# EAGLE design PWM Driver (EAGLE 9.6.2)
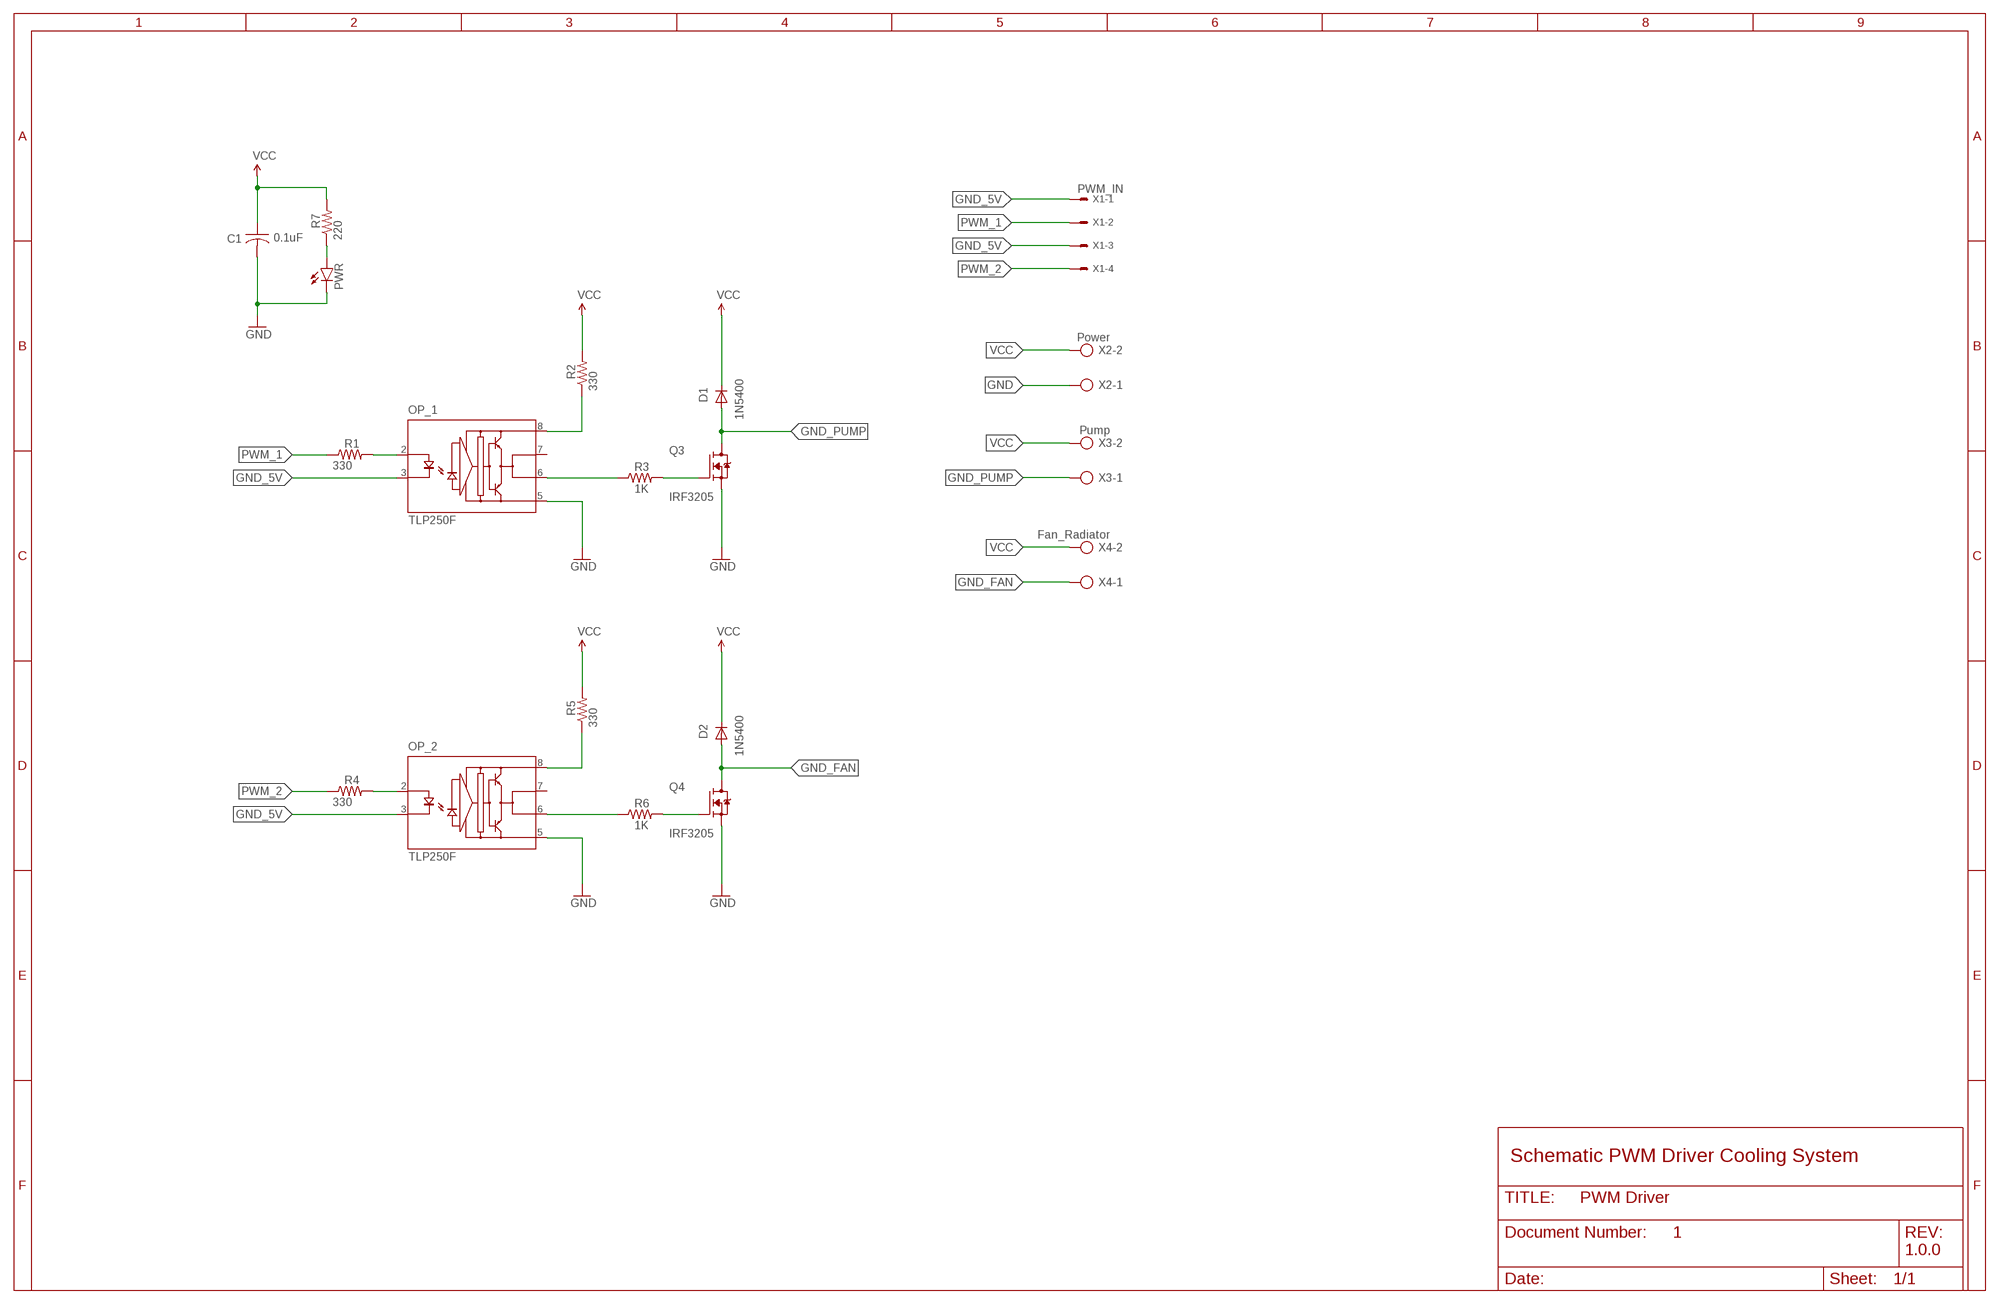
[diagram p0: schematic, sheet 1]
FRAME1 (FRAME_B_L): DESIGNER: PRATIK MAKWANA; DOC: 1; REV: 1.0.0

## Parts
C1  0.1uF  C-US050-030X075  [C050-030X075]
D1  1N5400  [DO201-15]
D2  1N5400  [DO201-15]
OP_1  TLP250F  [DIL08]
OP_2  TLP250F  [DIL08]
PWR  LED5MM  [LED5MM]
Q3  IRF3205  [TO254P1041X444X2933-3]
Q4  IRF3205  [TO254P1041X444X2933-3]
R1  330  R-US_0207/10  [0207/10]
R2  330  R-US_0411/15  [0411/15]
R3  1K  R-US_0411/15  [0411/15]
R4  330  R-US_0207/10  [0207/10]
R5  330  R-US_0411/15  [0411/15]
R6  1K  R-US_0411/15  [0411/15]
R7  220  R-US_0207/10  [0207/10]
X1  PWM_IN  22-23-2041  [22-23-2041]
X2  Power  AK500/2  [AK500/2]
X3  Pump  AK500/2  [AK500/2]
X4  Fan_Radiator  AK500/2  [AK500/2]

## Nets
GND: C1.2 OP_1.5(GND) OP_2.5(GND) PWR.K(C) Q3.3(S) Q4.3(S) X2.1
GND_5V: OP_1.3(K) OP_2.3(K) X1.1 X1.3
GND_FAN: D2.A Q4.2(D) X4.1
GND_PUMP: D1.A Q3.2(D) X3.1
N$1: OP_2.2(A) R4.2
N$2: OP_1.2(A) R1.2
N$3: OP_2.6(VO) R6.1
N$4: OP_1.6(VO) R3.1
N$5: Q3.1(G) R3.2
N$6: PWR.A R7.1
N$7: OP_1.8(VCC) R2.1
N$8: Q4.1(G) R6.2
N$9: OP_2.8(VCC) R5.1
PWM_1: R1.1 X1.2
PWM_2: R4.1 X1.4
VCC: C1.1 D1.C D2.C R2.2 R5.2 R7.2 X2.2 X3.2 X4.2
Unconnected: OP_1.7(VO') OP_2.7(VO')

## Notes on the sheet
- Schematic PWM Driver Cooling System

## Library data of the parts
C1 = adafruit:C-US: CAPACITOR, American symbol
D1 D2 = diode:1N5400: DIODE standard rectifier, 3 A, 50 V (Motorola)
OP_1 OP_2 = optocoupler-3-jcn:TLP250F: Toshiba Transistor Inverter Inverter For Air Conditionor IGBT Gate Drive Power MOS FET Gate Drive
PWR = led:LED: LED OSRAM: - CHIPLED LG R971, LG N971, LY N971, LG Q971, LY Q971, LO R971, LY R971 LH N974, LH R974 LS Q976, LO Q976, LY Q976 LO Q996 - Hyper CHIPLED LW Q18S LB Q993, LB Q99A, LB R99A - SideLED LS A670, LO A670, LY A670, LG A670, LP A670 LB A673, LV A673, LT A673, LW A673 LH A674 LY A675 LS A676, LA A676, LO A676, LY A676, LW A676 LS A679, LY A679, LG A679 - Hyper Micro SIDELED® LS Y876, LA Y876, LO Y876, LY Y876 LT Y87S - SmartLED LW L88C, LW L88S LB L89C, LB L89S, LG L890 LS L89K, LO L89K, LY L89K LS L896, LA L896, LO L896, LY L896 - TOPLED LS T670, LO T670, LY T670, LG T670, LP T670 LSG T670, LSP T670, LSY T670, LOP T670, LYG T670 LG T671, LOG T671, LSG T671 LB T673, LV T673, LT T673, LW T673 LH T674 LS T676, LA T676, LO T676, LY T676, LB T676, LH T676, LSB T676, LW T676 LB T67C, LV T67C, LT T67C, LS T67K, LO T67K, LY T67K, LW E67C LS E67B, LA E67B, LO E67B, LY E67B, LB E67C, LV E67C, LT E67C LW T67C LS T679, LY T679, LG T679 LS T770, LO T770, LY T770, LG T770, LP T770 LB T773, LV T773, LT T773, LW T773 LH T774 LS E675, LA E675, LY E675, LS T675 LS T776, LA T776, LO T776, LY T776, LB T776 LHGB T686 LT T68C, LB T68C - Hyper Mini TOPLED® LB M676 - Mini TOPLED Santana® LG M470 LS M47K, LO M47K, LY M47K Source: http://www.osram.convergy.de LUXEON: - LUMILED® LXK2-PW12-R00, LXK2-PW12-S00, LXK2-PW14-U00, LXK2-PW14-V00 LXK2-PM12-R00, LXK2-PM12-S00, LXK2-PM14-U00 LXK2-PE12-Q00, LXK2-PE12-R00, LXK2-PE12-S00, LXK2-PE14-T00, LXK2-PE14-U00 LXK2-PB12-K00, LXK2-PB12-L00, LXK2-PB12-M00, LXK2-PB14-N00, LXK2-PB14-P00, LXK2-PB14-Q00 LXK2-PR12-L00, LXK2-PR12-M00, LXK2-PR14-Q00, LXK2-PR14-R00 LXK2-PD12-Q00, LXK2-PD12-R00, LXK2-PD12-S00 LXK2-PH12-R00, LXK2-PH12-S00 LXK2-PL12-P00, LXK2-PL12-Q00, LXK2-PL12-R00 Source: www.luxeon.com KINGBRIGHT: KA-3528ASYC Source: www.kingbright.com
Q3 Q4 = IRF3205:IRF3205: N-Channel 55V 75A (Tc) 170W (Tc) Through Hole TO-220AB Check availability <https://pricing.snapeda.com/parts/IRF3205/Infineon%20Technologies/view-part?ref=eda>; AVAILABILITY: In Stock; CHECK_PRICES: https://www.snapeda.com/parts/IRF3205/Infineon/view-part/?ref=eda; DESCRIPTION: N-Channel 55V 110A (Tc) 200W (Tc) Through Hole TO-220AB; MF: Infineon Technologies; MP: IRF3205; PACKAGE: TO-220 Infineon; PRICE: None; SNAPEDA_LINK: https://www.snapeda.com/parts/IRF3205/Infineon/view-part/?ref=snap
R1-R7 = adafruit:R-US_: RESISTOR, American symbol
X1 = con-molex:22-23-2041: .100" (2.54mm) Center Header - 4 Pin; MF: MOLEX; MPN: 22-23-2041; OC_FARNELL: 1462920; OC_NEWARK: 38C0355
X2-X4 = con-ptr500:AK500/2: CONNECTOR; OC_FARNELL: unknown; OC_NEWARK: unknown

## Board
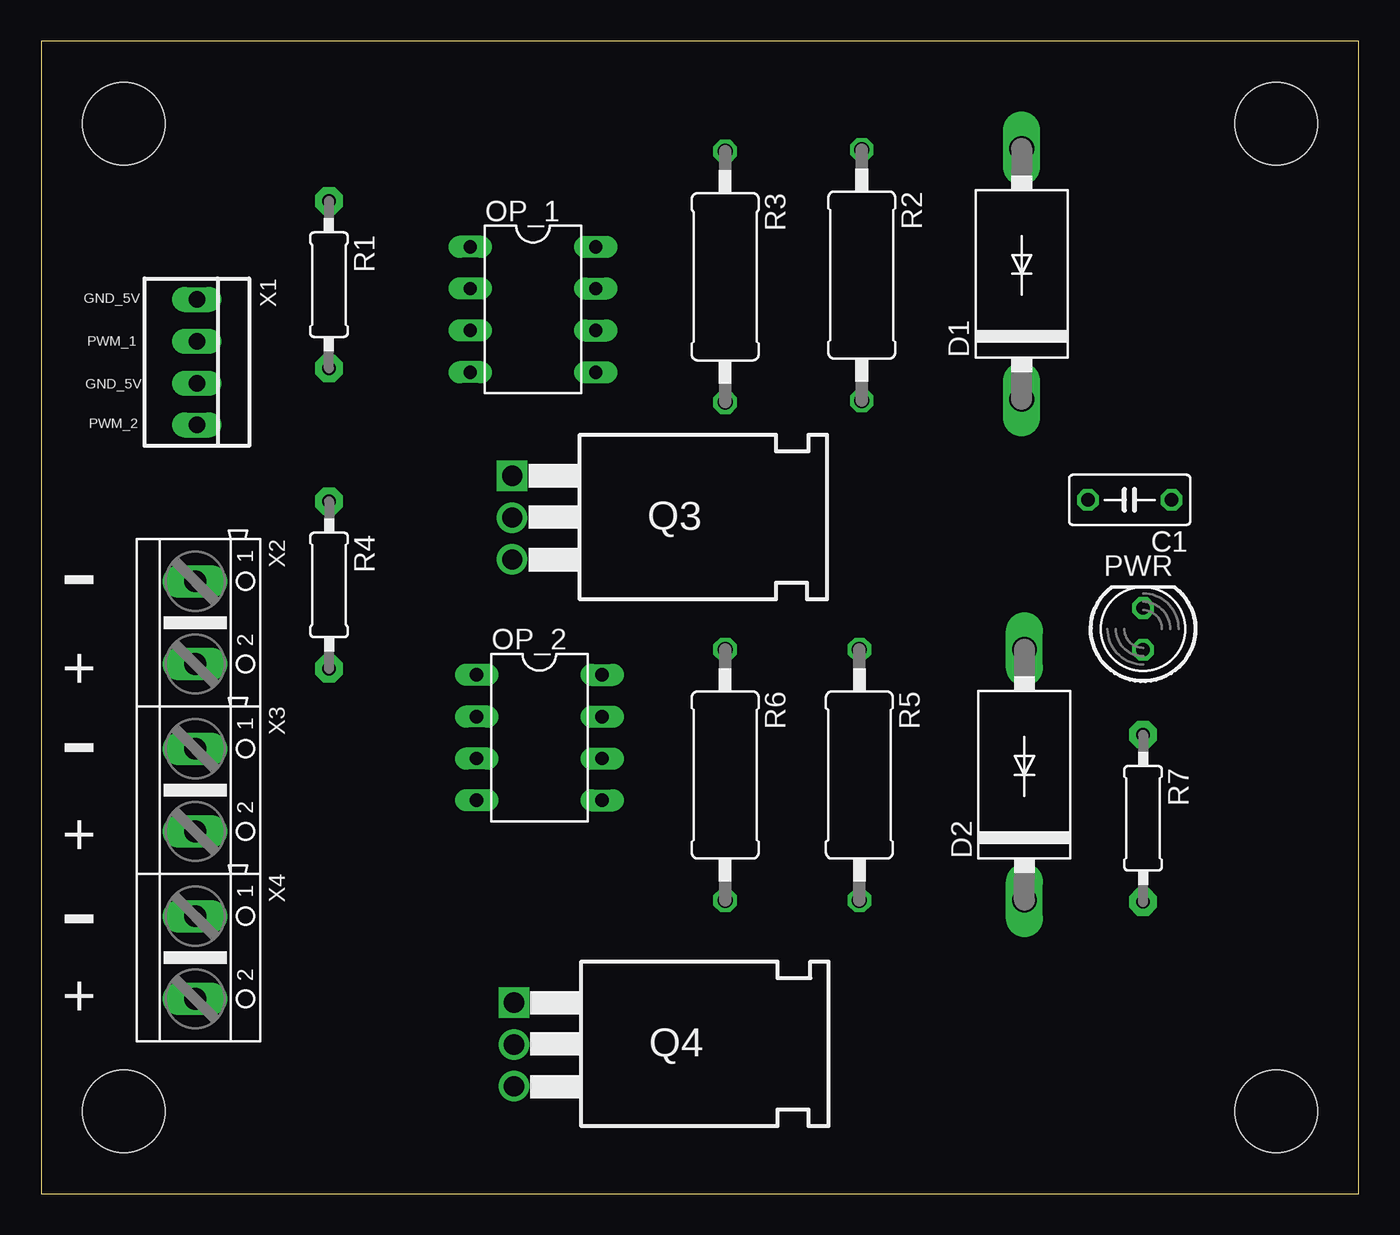
[diagram p1: board, top side]
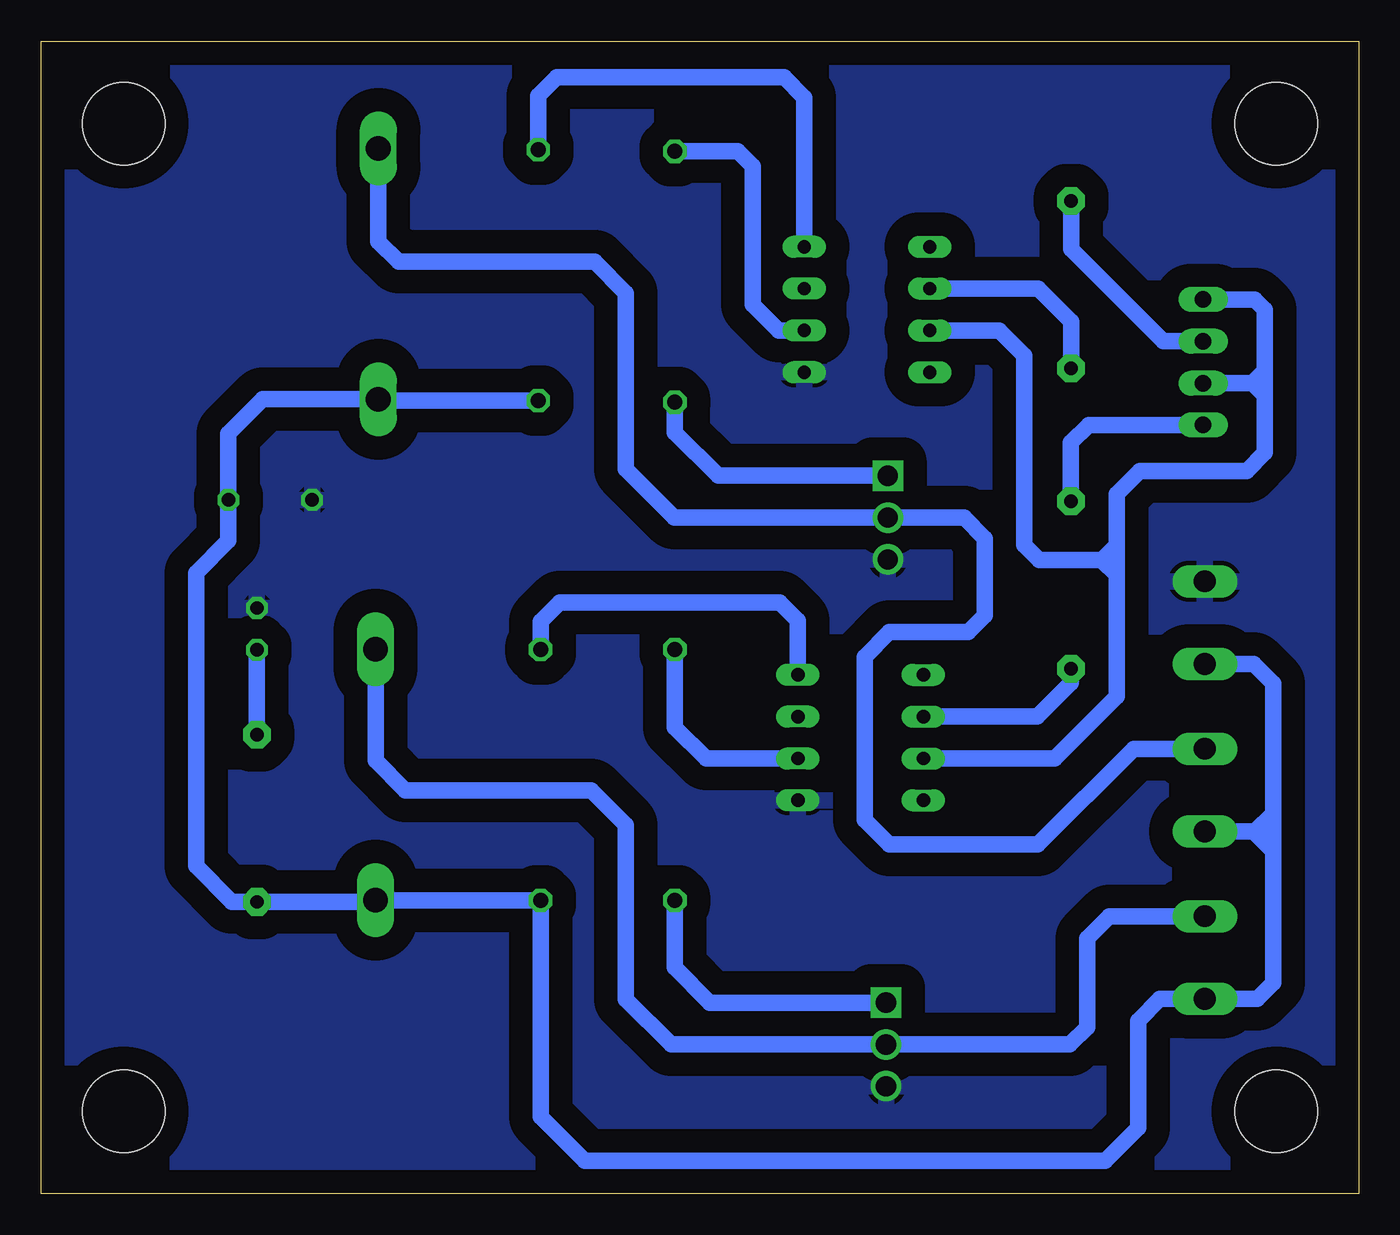
[diagram p2: board, bottom side, seen from below]

Size 80 x 70 mm. Coordinates in mm from the lower left corner, seen from the top.
Outline: 0,0 80,0 80,70 0,70 0,0
Copper layers (1*16): Top 0.035mm / dielectric 1.5mm / Bottom 0.035mm
Design rules "default": minimum track width 6mil, minimum drill 0.35mm, track to track 6mil, track to pad 6mil, pad to pad 6mil, via to via 6mil, smd to smd 6mil, copper to edge 40mil, drill to drill 6mil, minimum pad ring 10mil, minimum via ring 8mil, stop-mask expansion 4mil, vias tented up to drill 0mil, thermal gap 10mil
Holes 5 mm at 5,65 5,5 75,5 75,65

### Footprints (pad centres in the part's own frame; a part is rotated, then mirrored left to right if it is on the bottom)
C050-030X075 = drill 0.813 octagon: 1 -2.54,0; 2 2.54,0
DO201-15 = drill 1.499 long: A 7.62,0; C -7.62,0
DIL08 = drill 0.813 long: 1 -3.81,-3.81; 2 -1.27,-3.81; 3 1.27,-3.81; 4 3.81,-3.81; 5 3.81,3.81; 6 1.27,3.81; 7 -1.27,3.81; 8 -3.81,3.81
LED5MM = drill 0.813 octagon: A -1.27,0; K 1.27,0
TO254P1041X444X2933-3 = drill 1.23 pad 1.85 square: 1 2.5,-4.2 | drill 1.23 pad 1.85: 2 5.04,-4.2; 3 7.58,-4.2
0207/10 = drill 0.813 pad 1.676 octagon: 1 -5.08,0; 2 5.08,0
0411/15 = drill 0.914 octagon: 1 -7.62,0; 2 7.62,0
22-23-2041 = drill 1 long: 1 -3.81,0; 2 -1.27,0; 3 1.27,0; 4 3.81,0
AK500/2 = drill 1.321 long: 1 -2.515,0; 2 2.515,0

### Placement (x,y rotation side)
C1  66.09,42.14 180 top
D1  59.53,55.87 90 top
D2  59.7,25.44 90 top
OP_1  29.86,53.7 270 top
OP_2  30.25,27.7 270 top
PWR  66.9,34.3 90 top
Q3  32.8,46.1 270 top
Q4  32.9,14.1 270 top
R1  17.47,55.21 270 top
R2  49.82,55.79 270 top
R3  41.53,55.69 270 top
R4  17.48,36.97 270 top
R5  49.68,25.43 270 top
R6  41.53,25.43 270 top
R7  66.9,22.8 270 top
X1  9.45,50.5 270 top
X2  9.35,34.68 270 top
X3  9.35,24.51 270 top
X4  9.35,14.34 270 top

### Tracks (layer width: path | path; a pad name or v marks a point on that pad's centre or on a via)
GND
  pour Bottom (isolate 1.422): 0,70 80,70 80,0 0,0
GND_5V
  Bottom 1.016: 14.7,39.4 15.6,38.5 | 15.6,38.5 19.4,38.5 20.3,39.4 20.3,50.9 21.83,52.43 OP_1.3 | OP_2.3 18.47,26.43 14.7,30.2 14.7,37.6 | 14.7,37.6 14.7,39.4 | 15.6,38.5 14.7,37.6 | X1.3 6.47,49.23 | 5.7,50 6.47,49.23 | 5.7,50 5.7,53.7 6.31,54.31 X1.1 | 14.7,39.4 14.7,42.5 13.3,43.9 6.8,43.9 5.7,45 5.7,48.46 | 5.7,48.46 5.7,50 | 6.47,49.23 5.7,48.46
GND_FAN
  Bottom 1.016: D2.A 59.7,26.3 57.9,24.5 46.6,24.5 44.5,22.4 44.5,11.8 41.76,9.06 Q4.2 17.54,9.06 16.5,10.1 16.5,15.5 15.14,16.86 X4.1
GND_PUMP
  Bottom 1.016: X3.1 13.68,27.02 19.5,21.2 28.5,21.2 30,22.7 30,32.6 28.5,34.1 23.7,34.1 22.7,35.1 22.7,39.8 23.96,41.06 Q3.2 41.56,41.06 44.5,44 44.5,54.7 46.4,56.6 58.3,56.6 59.53,57.83 D1.A
N$1
  Bottom 1.016: OP_2.2 19.53,28.97 17.48,31.02 R4.2
N$2
  Bottom 1.016: R1.2 17.47,52.97 19.47,54.97 OP_1.2
N$3
  Bottom 1.016: OP_2.6 39.63,26.43 41.53,28.33 R6.1
N$4
  Bottom 1.016: OP_1.6 35.23,52.43 36.8,54 36.8,62.4 37.71,63.31 R3.1
N$5
  Bottom 1.016: Q3.1 38.9,43.6 41.53,46.23 R3.2
N$6
  Bottom 1.016: PWR.A R7.1
N$7
  Bottom 1.016: R2.1 49.82,66.68 48.7,67.8 34.9,67.8 33.67,66.57 OP_1.8
N$8
  Bottom 1.016: Q4.1 39.4,11.6 41.53,13.73 R6.2
N$9
  Bottom 1.016: OP_2.8 34.06,34.81 35.15,35.9 48.53,35.9 49.68,34.75 R5.1
PWM_1
  Bottom 1.016: R1.1 17.47,57.37 11.87,51.77 X1.2
PWM_2
  Bottom 1.016: R4.1 17.48,45.62 16.41,46.69 X1.4
VCC
  Bottom 1.016: 5.2,20.8 5.2,12.8 6.17,11.82 X4.2 12.07,11.82 13.4,10.5 13.4,4 15.4,2 47,2 49.68,4.68 R5.2 D2.C 59.8,17.72 R7.2 68.42,17.72 70.6,19.9 70.6,37.7 68.63,39.67 C1.1 68.63,46.17 66.55,48.25 D1.C 59.45,48.17 R2.2 | 5.2,20.8 6.39,22 X3.2 6.3,22 5.2,23.1 | X2.2 6.37,32.16 5.2,31 5.2,23.1 | 5.2,23.1 5.2,20.8

### Text on the board
tNames: GND_5V | PWM_1 | GND_5V | PWM_2 | - | + | - | + | - | +